# Altium schematic sheet Specfication.SchDoc
size A; SheetNumber: 1; SheetTotal: 9
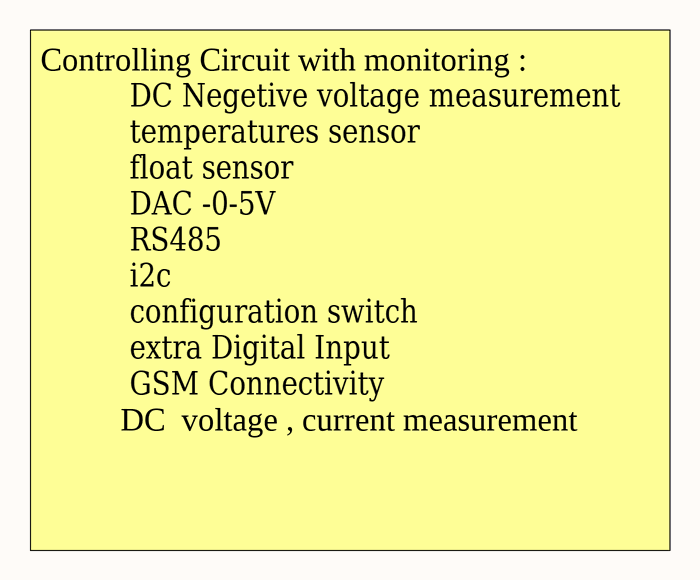
[diagram p0: Specfication.SchDoc]

## Notes on the sheet
- Controlling Circuit with monitoring :
  ⁠          DC Negetive voltage measurement
  ⁠          temperatures sensor
  ⁠          float sensor
  ⁠DAC -0-5V
  ⁠          RS485
  ⁠          i2c
  ⁠          configuration switch
  ⁠          extra Digital Input
  ⁠GSM Connectivity
  DC  voltage , current measurement